# Altium project TaskAltium.PrjPcb
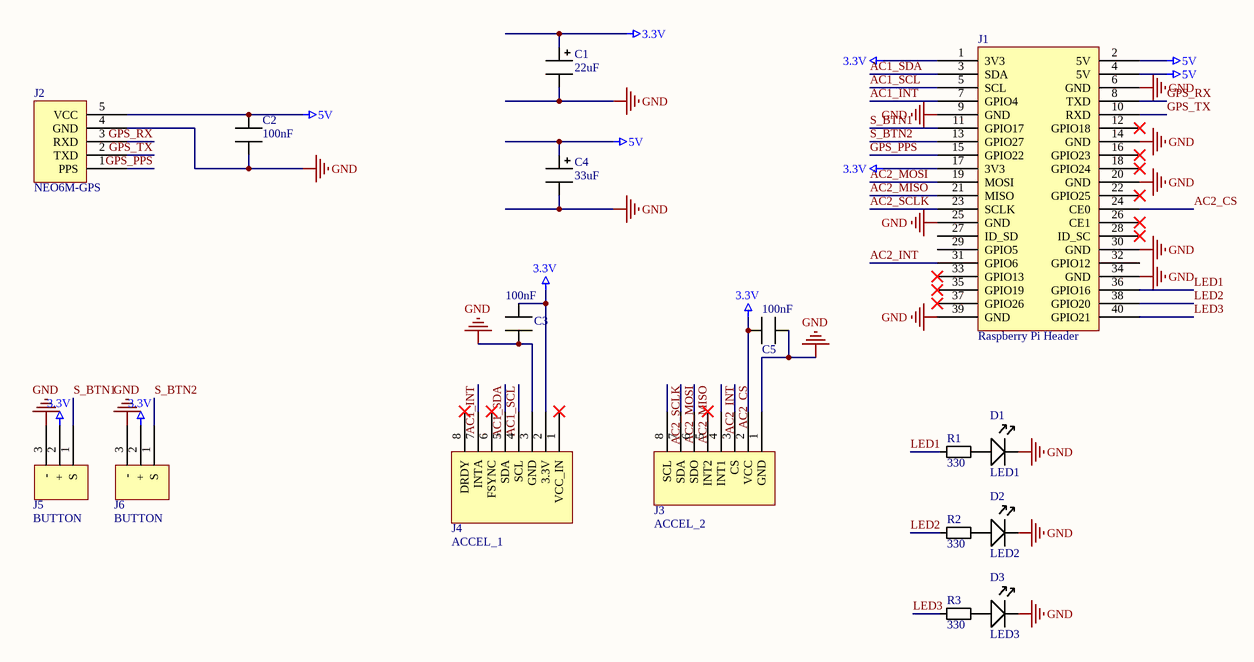
[diagram p0: TaskAltium.SchDoc]
1 sheet, 17 parts. Net scope: global (net labels, ports and power ports of the same name join across sheets).
Board file: TaskAltium.PcbDoc

## Sheet TaskAltium.SchDoc
size A4; SheetNumber: 1; SheetTotal: 1

### Parts
C1  22uF  [CAPACITOR_POL]
C2  100nF  [CAP]
C3  100nF  [CAP]
C4  33uF  [CAPACITOR_POL]
C5  100nF  [CAP]
D1  LED1  [LED_5MM]
D2  LED2  [LED_5MM]
D3  LED3  [LED_5MM]
J1  Raspberry Pi Header  [HDR_2x20_2.54_BOTTOM]
J2  NEO6M-GPS  [HDR_1x5]
J3  ACCEL_2  [HDR_1x8_2MOUNT]
J4  ACCEL_1  [HDR_1x8_1MOUNT]
J5  BUTTON  [HDR_1X3]
J6  BUTTON  [HDR_1X3]
R1  330  [RESISTOR_AXIAL_400]
R2  330  [RESISTOR_AXIAL_400]
R3  330  [RESISTOR_AXIAL_400]

### Nets
3.3V: C1.1 C3.2 C5.1 J1.1(3V3) J1.17(3V3) J3.2(VCC) J4.2(3.3V) J5.2(+) J6.2(+)
5V: C2.2 C4.1 J1.2(5V) J1.4(5V) J2.5(VCC)
GND: C1.2(+) C2.1 C3.1 C4.2(+) C5.2 D1.2(K) D2.2(K) D3.2(K) J1.6(GND) J1.9(GND) J1.14(GND) J1.20(GND) J1.25(GND) J1.30(GND) J1.34(GND) J1.39(GND) J2.4(GND) J3.1(GND) J4.3(GND) J5.3(-) J6.3(-)
AC1_INT: J1.7(GPIO4) J4.7(INTA)
AC1_SCL: J1.5(SCL) J4.4(SCL)
AC1_SDA: J1.3(SDA) J4.5(SDA)
AC2_CS: J1.24(CE0) J3.3(CS)
AC2_INT: J1.31(GPIO6) J3.4(INT1)
AC2_MISO: J1.21(MISO) J3.6(SDO)
AC2_MOSI: J1.19(MOSI) J3.7(SDA)
AC2_SCLK: J1.23(SCLK) J3.8(SCL)
GPS_PPS: J1.15(GPIO22) J2.1(PPS)
GPS_RX: J1.8(TXD) J2.3(RXD)
GPS_TX: J1.10(RXD) J2.2(TXD)
LED1: J1.36(GPIO16) R1.1
LED2: J1.38(GPIO20) R2.1
LED3: J1.40(GPIO21) R3.1
S_BTN1: J1.11(GPIO17) J5.1(S)
S_BTN2: J1.13(GPIO27) J6.1(S)
NetD1_1: D1.1(A) R1.2
NetD2_1: D2.1(A) R2.2
NetD3_1: D3.1(A) R3.2

Not connected (* = marked no-connect by the designer): J1 12(GPIO18)* 16(GPIO23)* 18(GPIO24)* 22(GPIO25)* 26(CE1)* 27(ID_SD) 28(ID_SC)* 29(GPIO5) 32(GPIO12) 33(GPIO13)* 35(GPIO19)* 37(GPIO26)*; J3 5(INT2)*; J4 1(VCC_IN)* 6(FSYNC)* 8(DRDY)*

### Library data of the parts
C1 C4 = CAP_POL
C2 C3 C5 = CAP
D1-D3 = LED
J1 = RPI_HDR_2x20
J2 = GPS_NEO6M
R1-R3 = RES